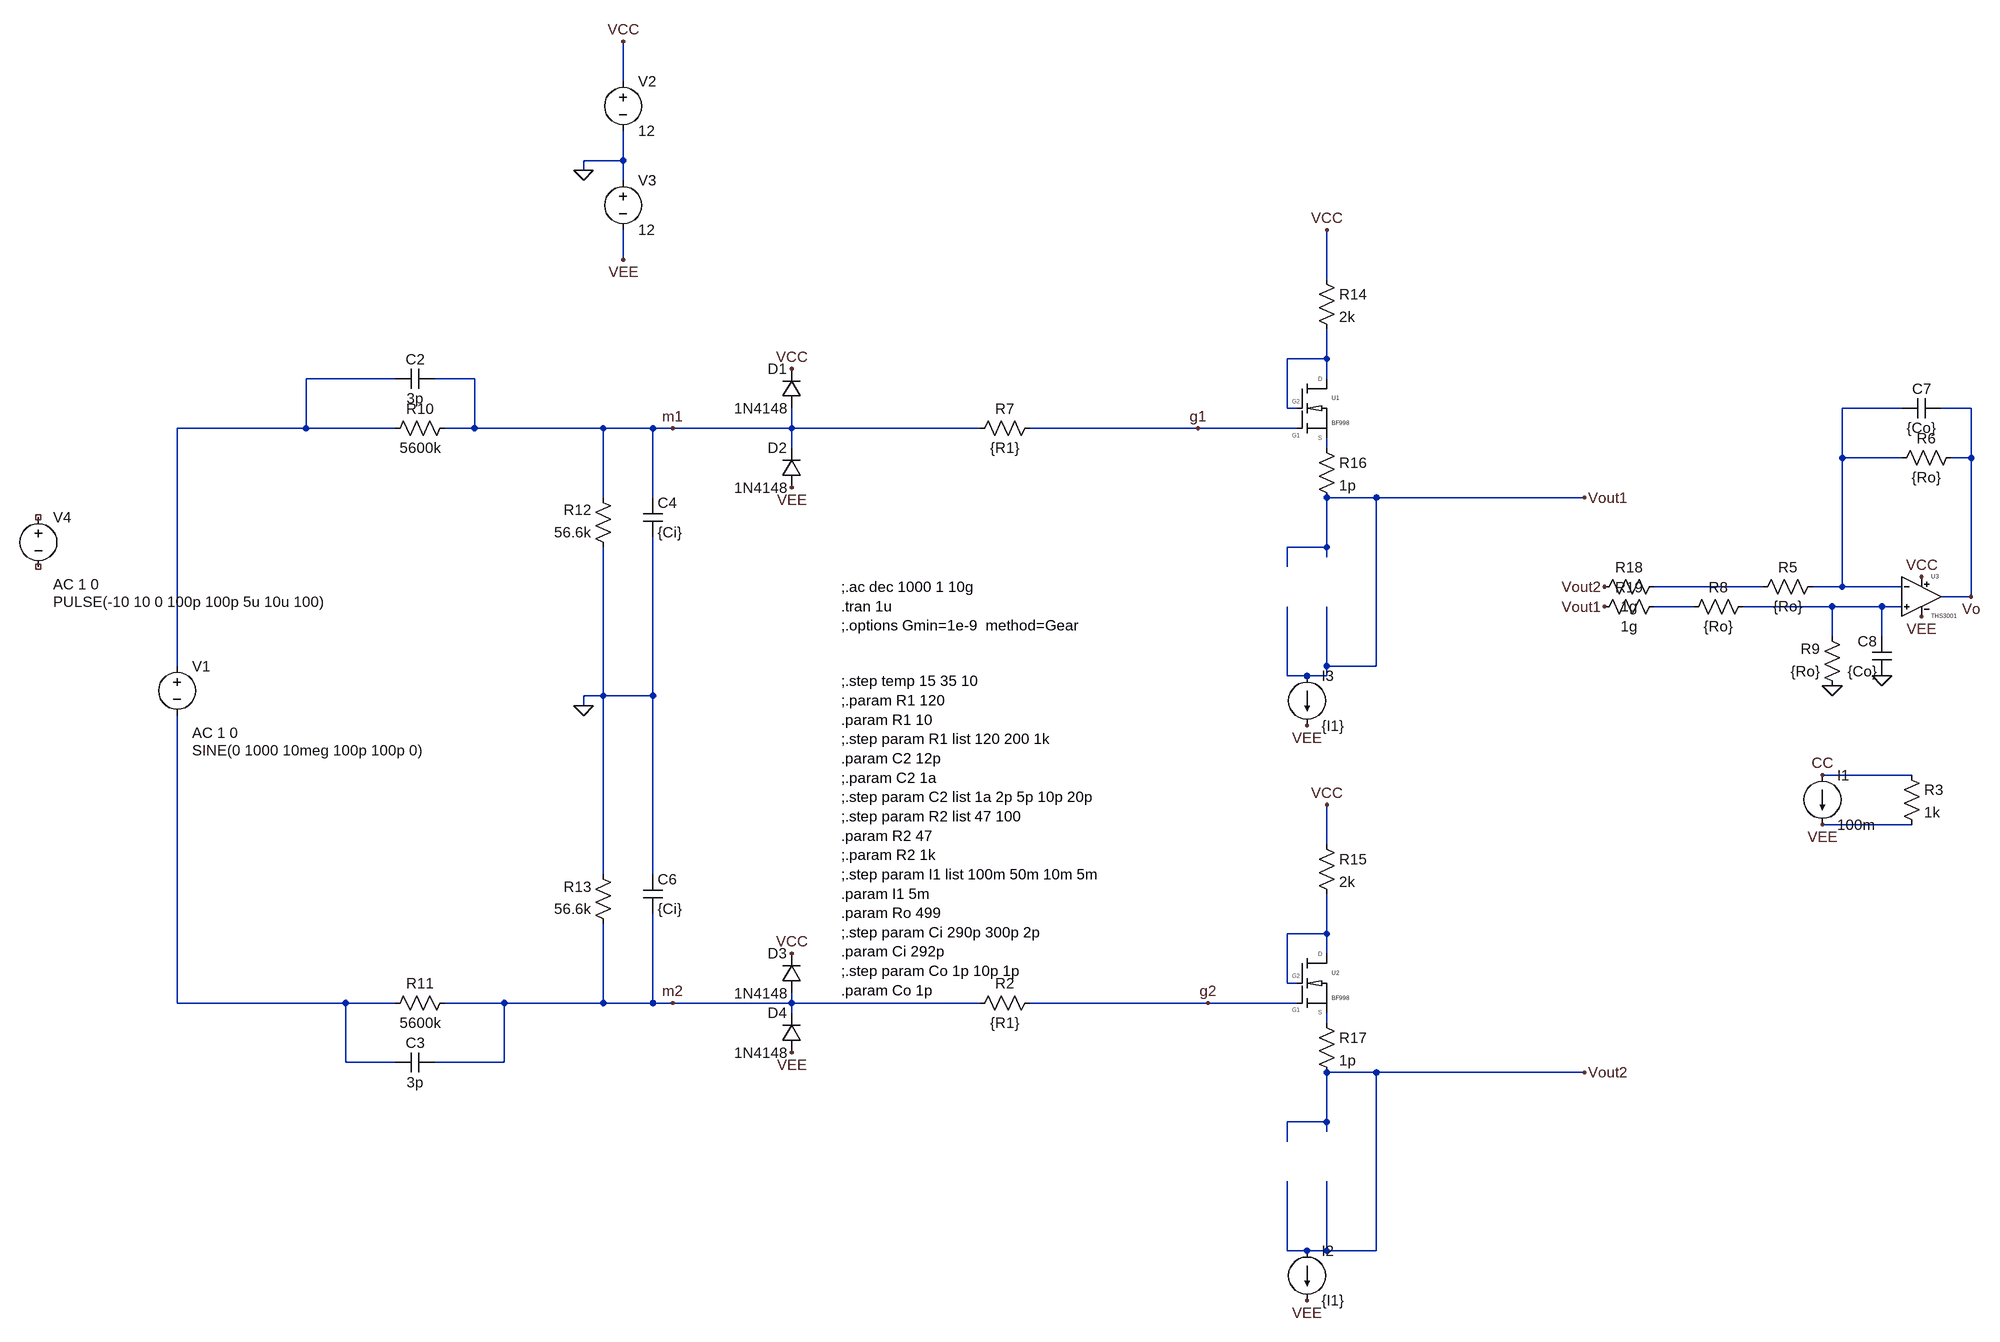
[diagram p0: schematic differential_probe_input_fet_bf998.asc]
differential_probe_input_fet_bf998.asc, the LTspice schematic file:
Version 4
SHEET 1 1296 1756
WIRE -912 -352 -912 -416
WIRE -912 -224 -912 -272
WIRE -912 -224 -976 -224
WIRE -976 -208 -976 -224
WIRE -912 -192 -912 -224
WIRE -912 -64 -912 -112
WIRE 224 -32 224 -112
WIRE 224 96 224 48
WIRE 224 96 160 96
WIRE -1280 128 -1424 128
WIRE -1152 128 -1216 128
WIRE 224 128 224 96
WIRE 160 176 160 96
WIRE 176 176 160 176
WIRE 1152 176 1056 176
WIRE 1264 176 1216 176
WIRE -1424 208 -1424 128
WIRE -1424 208 -1632 208
WIRE -1280 208 -1424 208
WIRE -1152 208 -1152 128
WIRE -1152 208 -1200 208
WIRE -944 208 -1152 208
WIRE -864 208 -944 208
WIRE -832 208 -864 208
WIRE -640 208 -640 176
WIRE -640 208 -832 208
WIRE -336 208 -640 208
WIRE 16 208 -256 208
WIRE 176 208 16 208
WIRE -640 240 -640 208
WIRE 224 240 224 224
WIRE 1056 256 1056 176
WIRE 1152 256 1056 256
WIRE 1264 256 1264 176
WIRE 1264 256 1232 256
WIRE -944 320 -944 208
WIRE -864 320 -864 208
WIRE 304 320 224 320
WIRE 640 320 304 320
WIRE 224 400 224 320
WIRE 224 400 160 400
WIRE 224 416 224 400
WIRE 160 432 160 400
WIRE 928 464 752 464
WIRE 1056 464 1056 256
WIRE 1056 464 1008 464
WIRE 1152 464 1056 464
WIRE 1264 480 1264 256
WIRE 1264 480 1216 480
WIRE 816 496 752 496
WIRE 1040 496 896 496
WIRE 1120 496 1040 496
WIRE 1152 496 1120 496
WIRE 1040 544 1040 496
WIRE 1120 544 1120 496
WIRE -1632 592 -1632 208
WIRE 224 592 224 496
WIRE 304 592 304 320
WIRE 304 592 224 592
WIRE 160 608 160 496
WIRE 192 608 160 608
WIRE 224 608 224 592
WIRE 224 608 192 608
WIRE -944 640 -944 400
WIRE -944 640 -976 640
WIRE -864 640 -864 384
WIRE -864 640 -944 640
WIRE -976 656 -976 640
WIRE 1168 768 1024 768
WIRE 1168 848 1024 848
WIRE 224 880 224 816
WIRE -944 928 -944 640
WIRE -864 928 -864 640
WIRE 224 1024 224 960
WIRE 224 1024 160 1024
WIRE 224 1056 224 1024
WIRE 160 1104 160 1024
WIRE 176 1104 160 1104
WIRE -1632 1136 -1632 672
WIRE -1360 1136 -1632 1136
WIRE -1280 1136 -1360 1136
WIRE -1104 1136 -1200 1136
WIRE -944 1136 -944 1008
WIRE -944 1136 -1104 1136
WIRE -864 1136 -864 992
WIRE -864 1136 -944 1136
WIRE -832 1136 -864 1136
WIRE -640 1136 -640 1120
WIRE -640 1136 -832 1136
WIRE -336 1136 -640 1136
WIRE 32 1136 -256 1136
WIRE 176 1136 32 1136
WIRE -640 1152 -640 1136
WIRE 224 1168 224 1152
WIRE -1360 1232 -1360 1136
WIRE -1280 1232 -1360 1232
WIRE -1104 1232 -1104 1136
WIRE -1104 1232 -1216 1232
WIRE 304 1248 224 1248
WIRE 640 1248 304 1248
WIRE 224 1328 224 1248
WIRE 224 1328 160 1328
WIRE 224 1344 224 1328
WIRE 160 1360 160 1328
WIRE 160 1536 160 1424
WIRE 192 1536 160 1536
WIRE 224 1536 224 1424
WIRE 224 1536 192 1536
WIRE 304 1536 304 1248
WIRE 304 1536 224 1536
FLAG 640 320 Vout1
FLAG -976 -208 0
FLAG 640 1248 Vout2
FLAG -912 -416 VCC
FLAG 224 -112 VCC
FLAG -912 -64 VEE
FLAG 1024 848 VEE
FLAG 192 1616 VEE
FLAG 224 816 VCC
FLAG 1024 768 CC
FLAG 192 688 VEE
FLAG 1040 624 0
FLAG 1184 512 VEE
FLAG 1184 448 VCC
FLAG 672 496 Vout1
FLAG 672 464 Vout2
FLAG 1264 480 Vo
FLAG -976 656 0
FLAG -640 1216 VEE
FLAG -640 304 VEE
FLAG -640 112 VCC
FLAG -640 1056 VCC
FLAG 1120 608 0
FLAG 16 208 g1
FLAG 32 1136 g2
FLAG -832 208 m1
FLAG -832 1136 m2
SYMBOL res -240 192 R90
WINDOW 0 0 56 VBottom 2
WINDOW 3 32 56 VTop 2
SYMATTR InstName R7
SYMATTR Value {R1}
SYMBOL voltage -1632 576 R0
WINDOW 3 24 152 Left 2
WINDOW 123 24 124 Left 2
WINDOW 39 0 0 Left 0
SYMATTR Value SINE(0 1000 10meg 100p 100p 0)
SYMATTR Value2 AC 1 0
SYMATTR InstName V1
SYMBOL voltage -912 -368 R0
WINDOW 123 0 0 Left 0
WINDOW 39 0 0 Left 0
SYMATTR InstName V2
SYMATTR Value 12
SYMBOL my\\BF998 176 128 R0
SYMATTR InstName U1
SYMBOL res -240 1120 R90
WINDOW 0 0 56 VBottom 2
WINDOW 3 32 56 VTop 2
SYMATTR InstName R2
SYMATTR Value {R1}
SYMBOL voltage -912 -208 R0
WINDOW 123 0 0 Left 0
WINDOW 39 0 0 Left 0
SYMATTR InstName V3
SYMATTR Value 12
SYMBOL my\\BF998 176 1056 R0
SYMATTR InstName U2
SYMBOL current 1024 768 R0
WINDOW 123 0 0 Left 0
WINDOW 39 0 0 Left 0
SYMATTR InstName I1
SYMATTR Value 100m
SYMBOL res 1152 752 R0
SYMATTR InstName R3
SYMATTR Value 1k
SYMBOL current 192 1536 R0
WINDOW 123 0 0 Left 0
WINDOW 39 0 0 Left 0
SYMATTR InstName I2
SYMATTR Value {I1}
SYMBOL current 192 608 R0
WINDOW 123 0 0 Left 0
WINDOW 39 0 0 Left 0
SYMATTR InstName I3
SYMATTR Value {I1}
SYMBOL my\\THS3001 1184 416 R0
SYMATTR InstName U3
SYMBOL res 1024 448 R90
WINDOW 0 0 56 VBottom 2
WINDOW 3 32 56 VTop 2
SYMATTR InstName R5
SYMATTR Value {Ro}
SYMBOL res 1248 240 R90
WINDOW 0 0 56 VBottom 2
WINDOW 3 32 56 VTop 2
SYMATTR InstName R6
SYMATTR Value {Ro}
SYMBOL res 912 480 R90
WINDOW 0 0 56 VBottom 2
WINDOW 3 32 56 VTop 2
SYMATTR InstName R8
SYMATTR Value {Ro}
SYMBOL res 1056 640 R180
WINDOW 0 36 76 Left 2
WINDOW 3 36 40 Left 2
SYMATTR InstName R9
SYMATTR Value {Ro}
SYMBOL res -1184 192 R90
WINDOW 0 0 56 VBottom 2
WINDOW 3 32 56 VTop 2
SYMATTR InstName R10
SYMATTR Value 5600k
SYMBOL res -1184 1120 R90
WINDOW 0 0 56 VBottom 2
WINDOW 3 32 56 VTop 2
SYMATTR InstName R11
SYMATTR Value 5600k
SYMBOL res -928 416 R180
WINDOW 0 36 76 Left 2
WINDOW 3 36 40 Left 2
SYMATTR InstName R12
SYMATTR Value 56.6k
SYMBOL res -928 1024 R180
WINDOW 0 36 76 Left 2
WINDOW 3 36 40 Left 2
SYMATTR InstName R13
SYMATTR Value 56.6k
SYMBOL cap -1216 112 R90
WINDOW 0 0 32 VBottom 2
WINDOW 3 32 32 VTop 2
SYMATTR InstName C2
SYMATTR Value 3p
SYMBOL cap -1216 1216 R90
WINDOW 0 0 32 VBottom 2
WINDOW 3 32 32 VTop 2
SYMATTR InstName C3
SYMATTR Value 3p
SYMBOL cap -880 320 R0
SYMATTR InstName C4
SYMATTR Value {Ci}
SYMBOL cap -880 928 R0
SYMATTR InstName C6
SYMATTR Value {Ci}
SYMBOL diode -624 176 R180
WINDOW 0 24 64 Left 2
WINDOW 3 24 0 Left 2
SYMATTR InstName D1
SYMATTR Value 1N4148
SYMBOL diode -624 304 R180
WINDOW 0 24 64 Left 2
WINDOW 3 24 0 Left 2
SYMATTR InstName D2
SYMATTR Value 1N4148
SYMBOL diode -624 1120 R180
WINDOW 0 24 64 Left 2
WINDOW 3 24 0 Left 2
SYMATTR InstName D3
SYMATTR Value 1N4148
SYMBOL diode -624 1216 R180
WINDOW 0 24 64 Left 2
WINDOW 3 24 0 Left 2
SYMATTR InstName D4
SYMATTR Value 1N4148
SYMBOL cap 1216 160 R90
WINDOW 0 0 32 VBottom 2
WINDOW 3 32 32 VTop 2
SYMATTR InstName C7
SYMATTR Value {Co}
SYMBOL cap 1136 608 R180
WINDOW 0 24 56 Left 2
WINDOW 3 24 8 Left 2
SYMATTR InstName C8
SYMATTR Value {Co}
SYMBOL res 208 -48 R0
SYMATTR InstName R14
SYMATTR Value 2k
SYMBOL res 208 864 R0
SYMATTR InstName R15
SYMATTR Value 2k
SYMBOL res 208 224 R0
SYMATTR InstName R16
SYMATTR Value 1p
SYMBOL res 208 1152 R0
SYMATTR InstName R17
SYMATTR Value 1p
SYMBOL res 768 448 R90
WINDOW 0 0 56 VBottom 2
WINDOW 3 32 56 VTop 2
SYMATTR InstName R18
SYMATTR Value 1g
SYMBOL res 768 480 R90
WINDOW 0 0 56 VBottom 2
WINDOW 3 32 56 VTop 2
SYMATTR InstName R19
SYMATTR Value 1g
SYMBOL voltage -1856 336 R0
WINDOW 3 24 152 Left 2
WINDOW 123 24 124 Left 2
WINDOW 39 0 0 Left 0
SYMATTR Value PULSE(-10 10 0 100p 100p 5u 10u 100)
SYMATTR Value2 AC 1 0
SYMATTR InstName V4
TEXT -560 464 Left 2 !;.ac dec 1000 1 10g\n.tran 1u\n;.options Gmin=1e-9  method=Gear
TEXT -560 616 Left 2 !;.step temp 15 35 10\n;.param R1 120\n.param R1 10\n;.step param R1 list 120 200 1k\n.param C2 12p\n;.param C2 1a\n;.step param C2 list 1a 2p 5p 10p 20p\n;.step param R2 list 47 100\n.param R2 47\n;.param R2 1k\n;.step param I1 list 100m 50m 10m 5m\n.param I1 5m\n.param Ro 499\n;.step param Ci 290p 300p 2p\n.param Ci 292p\n;.step param Co 1p 10p 1p\n.param Co 1p

The netlist it stands for:
* differential_probe_input_fet_bf998.asc
R7 g1 m1 {R1}
V1 N002 N009 SINE(0 1000 10meg 100p 100p 0) AC 1 0
V2 VCC 0 12
XU1 N004 N001 N001 g1 BF998  ; pins S D G2 G1
R2 g2 m2 {R1}
V3 0 VEE 12
XU2 N010 N008 N008 g2 BF998  ; pins S D G2 G1
I1 CC VEE 100m
R3 CC VEE 1k
I2 Vout2 VEE {I1}
I3 Vout1 VEE {I1}
XU3 N007 N003 VCC VEE Vo THS3001  ; pins IN+ IN- VCC VEE OUT
R5 N003 N005 {Ro}
R6 Vo N003 {Ro}
R8 N007 N006 {Ro}
R9 0 N007 {Ro}
R10 m1 N002 5600k
R11 m2 N009 5600k
R12 0 m1 56.6k
R13 m2 0 56.6k
C2 m1 N002 3p
C3 m2 N009 3p
C4 m1 0 {Ci}
C6 0 m2 {Ci}
D1 m1 VCC 1N4148
D2 VEE m1 1N4148
D3 m2 VCC 1N4148
D4 VEE m2 1N4148
C7 Vo N003 {Co}
C8 0 N007 {Co}
R14 VCC N001 2k
R15 VCC N008 2k
R16 N004 Vout1 1p
R17 N010 Vout2 1p
R18 N005 Vout2 1g
R19 N006 Vout1 1g
V4 NC_01 NC_02 PULSE(-10 10 0 100p 100p 5u 10u 100) AC 1 0
.model D D
.lib standard.dio
;.ac dec 1000 1 10g
.tran 1u
;.options Gmin=1e-9  method=Gear
;.step temp 15 35 10
;.param R1 120
.param R1 10
;.step param R1 list 120 200 1k
.param C2 12p
;.param C2 1a
;.step param C2 list 1a 2p 5p 10p 20p
;.step param R2 list 47 100
.param R2 47
;.param R2 1k
;.step param I1 list 100m 50m 10m 5m
.param I1 5m
.param Ro 499
;.step param Ci 290p 300p 2p
.param Ci 292p
;.step param Co 1p 10p 1p
.param Co 1p
.lib BF998.sub
.lib THS3001.lib
.backanno
.end